# Altium schematic sheet nc_Circuit.SchDoc
size Tabloid; Date: Date; Author: Author 1; Revision: 1; SheetNumber: 4; SheetTotal: 5; Size: 11x17; Sheet_Name: Circuit
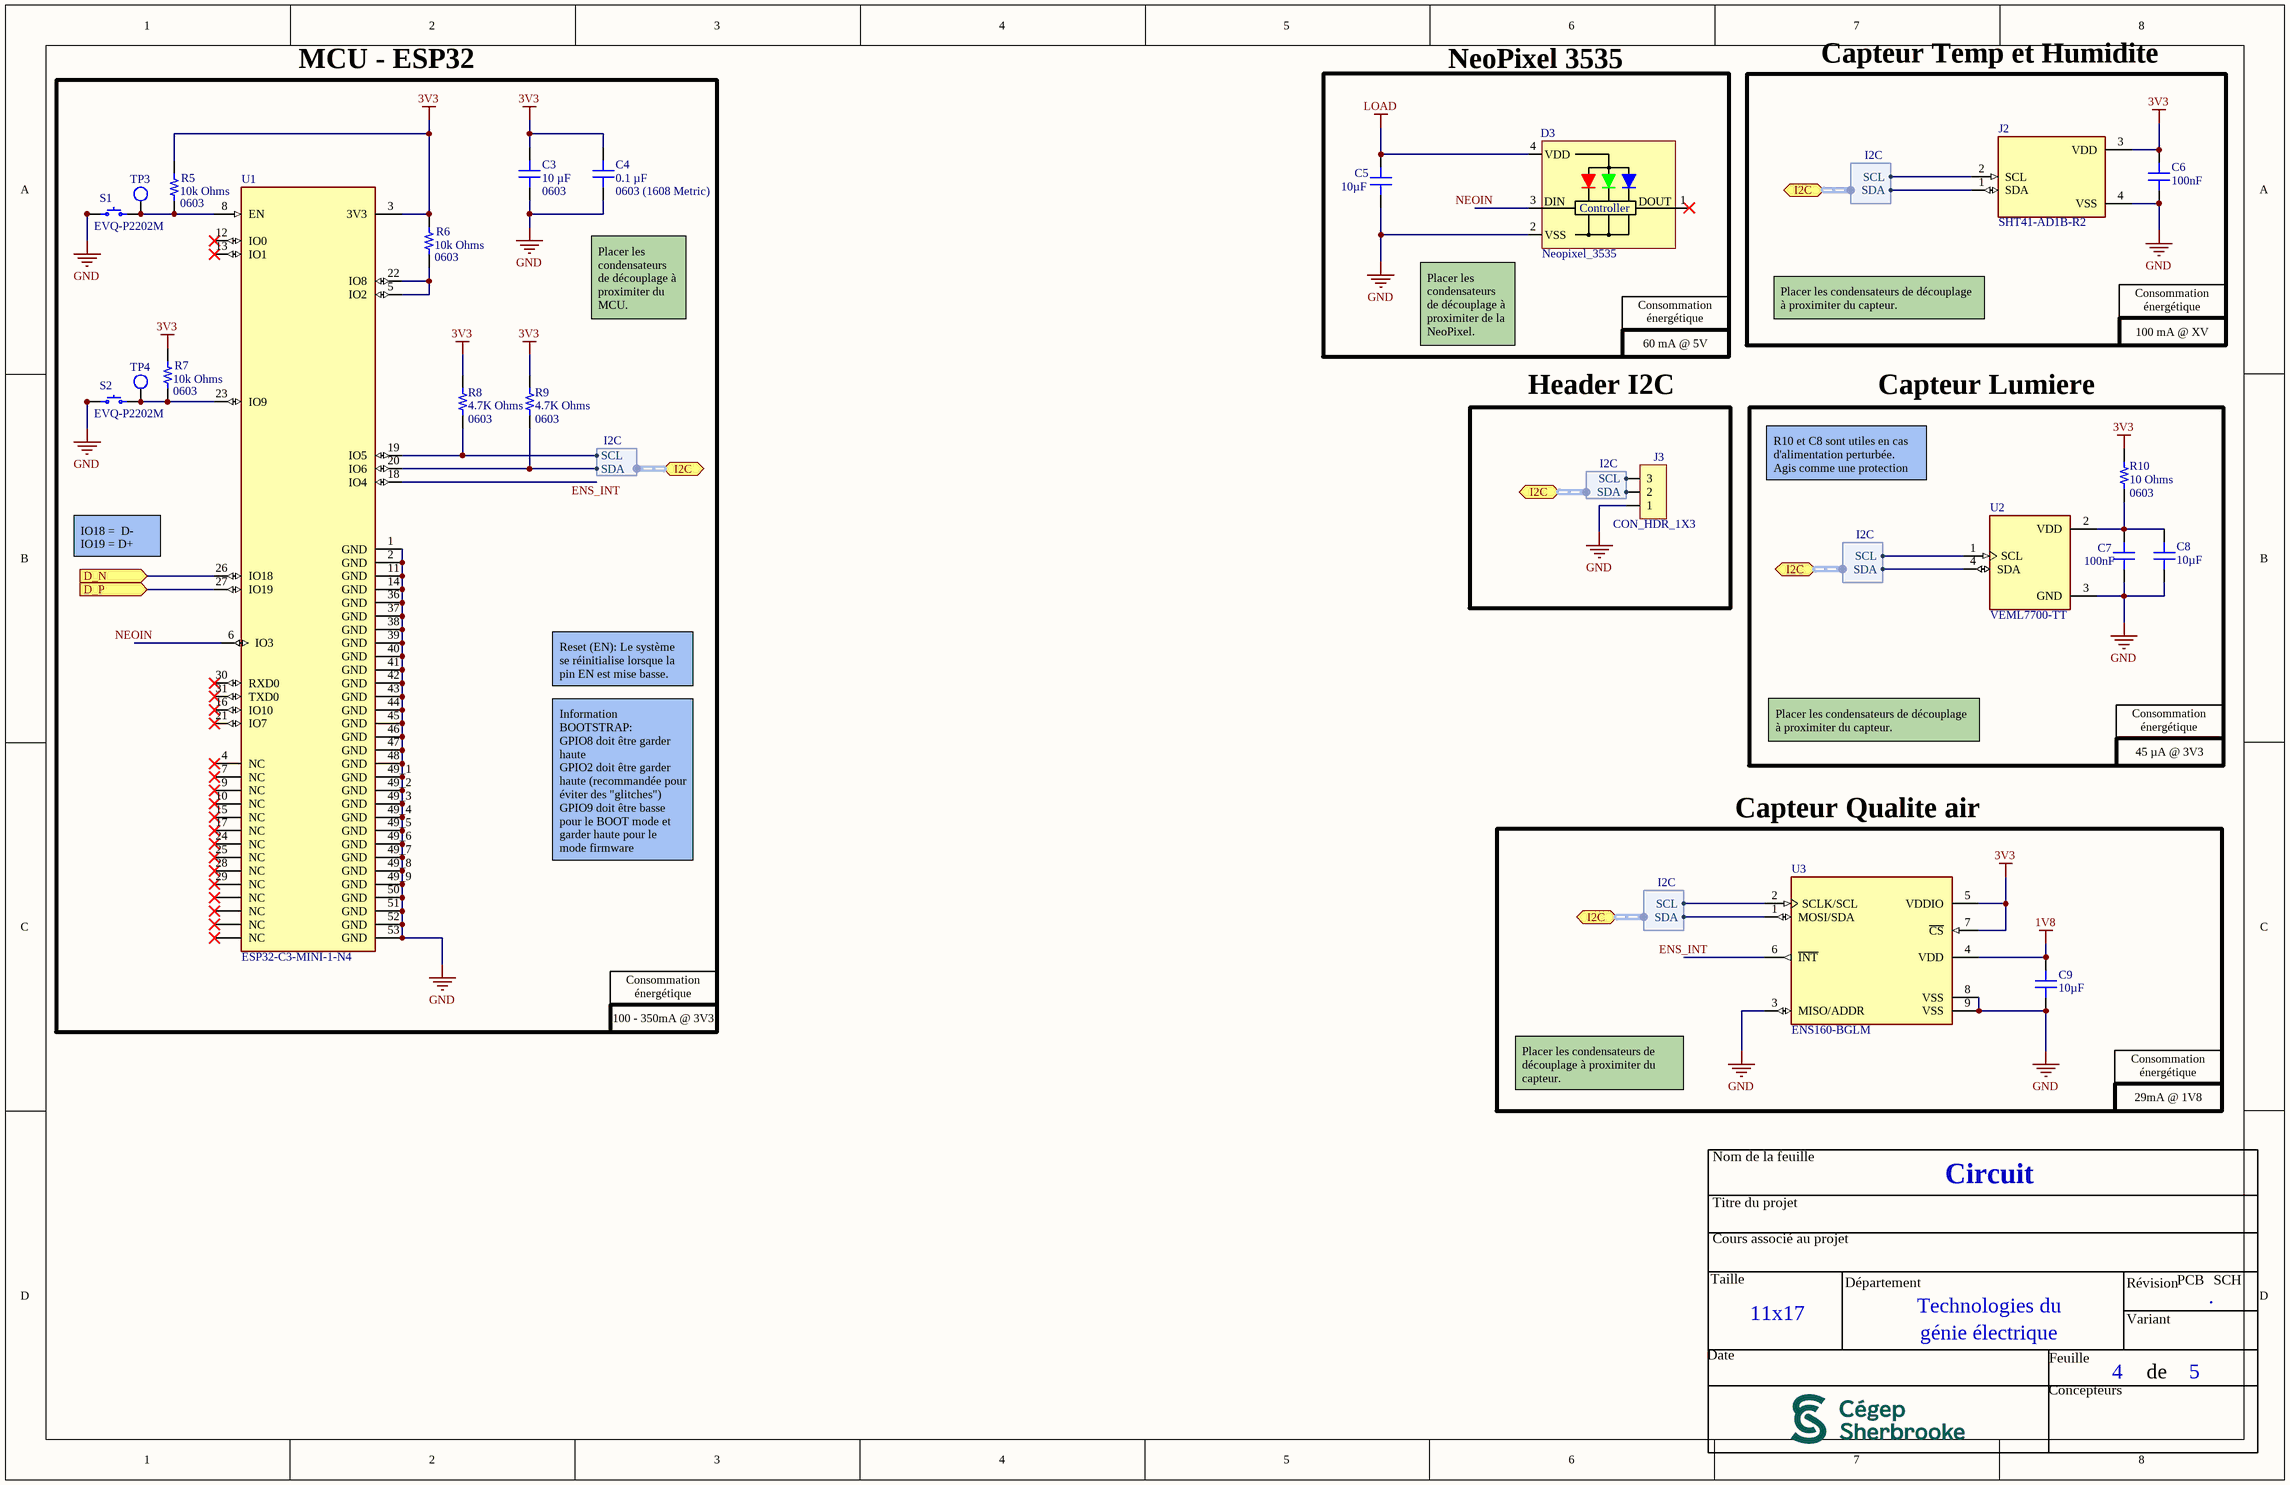
[diagram p0: nc_Circuit.SchDoc]

## Parts
C3  Device Package: 0603  [CAP 0603_1608]  (hidden comment: 10 µF)
C4  Device Package: 0603 (1608 Metric)  [CAP 0603_1608]  (hidden comment: 0.1 µF)
C5  Capacitance: 10µF  [CAP 0603_1608]  (hidden comment: 1µF)
C6  Capacitance: 100nF  [CAP 0603_1608]  (hidden comment: 1µF)
C7  Capacitance: 100nF  [CAP 0603_1608]  (hidden comment: 1µF)
C8  Capacitance: 10µF  [CAP 0603_1608]  (hidden comment: 1µF)
C9  Capacitance: 10µF  [CAP 0603_1608]  (hidden comment: 1µF)
D3  Neopixel_3535  [Neopixel_3535-Footprint-1]
J2  SHT41-AD1B-R2  [SHT4X]
J3  CON_HDR_1X3  [CON_HDR_1x3]
R5  Supplier Device Package: 0603  [RES 0603_1608]  (hidden comment: 10k Ohms)
R6  Supplier Device Package: 0603  [RES 0603_1608]  (hidden comment: 10k Ohms)
R7  Supplier Device Package: 0603  [RES 0603_1608]  (hidden comment: 10k Ohms)
R8  Supplier Device Package: 0603  [RES 0603_1608]  (hidden comment: 4.7K Ohms)
R9  Supplier Device Package: 0603  [RES 0603_1608]  (hidden comment: 4.7K Ohms)
R10  Supplier Device Package: 0603  [RES 0603_1608]  (hidden comment: 10 Ohms)
S1  EVQ-P2202M  [PANASONIC EVQP2]
S2  EVQ-P2202M  [PANASONIC EVQP2]
TP3  TPO_SMD_ROUND_2MM  [TPO_SMD_ROUND_2MM]  (value not drawn)  (no BOM)
TP4  TPO_SMD_ROUND_2MM  [TPO_SMD_ROUND_2MM]  (value not drawn)  (no BOM)
U1  ESP32-C3-MINI-1-N4  [XCVR_ESP32-C3-MINI-1-N4]
U2  VEML7700-TT  [XDCR_VEML7700-TT]
U3  ENS160-BGLM  [XDCR_ENS160-BGLM]

## Blocks framed on the sheet
MCU - ESP32: C3 C4 R5-R9 S1 S2 TP3 TP4 U1
NeoPixel 3535: C5 D3
Capteur Temp et Humidite: C6 J2
Header I2C: J3
Capteur Lumiere: C7 C8 R10 U2
Capteur Qualite air: C9 U3

## Ports
D_N (in), D_P (in), I2C (bidir, harness I2C)

## Harnesses
I2C: SCL, SDA

## Nets
1V8: C9.2 U3.4(VDD)
3V3: C3.2 C4.2 C6.2 J2.3(VDD) R5.1 R6.1 R7.1 R8.2 R9.2 R10.2 U1.3(3V3) U3.5(VDDIO) U3.7(~{CS})
GND: C3.1 C4.1 C5.1 C6.1 C7.1 C8.1 C9.1 D3.2(VSS) J2.4(VSS) J3.1 S1.1 S1.2 S2.1 S2.2 U1.1(GND) U1.2(GND) U1.11(GND) U1.14(GND) U1.36(GND) U1.37(GND) U1.38(GND) U1.39(GND) U1.40(GND) U1.41(GND) U1.42(GND) U1.43(GND) U1.44(GND) U1.45(GND) U1.46(GND) U1.47(GND) U1.48(GND) U1.49_1(GND) U1.49_2(GND) U1.49_3(GND) U1.49_4(GND) U1.49_5(GND) U1.49_6(GND) U1.49_7(GND) U1.49_8(GND) U1.49_9(GND) U1.50(GND) U1.51(GND) U1.52(GND) U1.53(GND) U2.3(GND) U3.3(MISO/ADDR) U3.8(VSS) U3.9(VSS)
LOAD: C5.2 D3.4(VDD)
D_N: U1.26(IO18) ; port D_N
D_P: U1.27(IO19) ; port D_P
ENS_INT: U1.18(IO4) U3.6(~{INT})
NEOIN: D3.3(DIN) U1.6(IO3)
NetC7_2: C7.2 C8.2 R10.1 U2.2(VDD)
NetJ2_1: J2.1(SDA) J3.2 R9.1 U1.20(IO6) U2.4(SDA) U3.1(MOSI/SDA) ; port I2C.SDA
NetJ2_2: J2.2(SCL) J3.3 R8.1 U1.19(IO5) U2.1(SCL) U3.2(SCLK/SCL) ; port I2C.SCL
NetR5_2: R5.2 S1.3 S1.4 TP3.1 U1.8(EN)
NetR6_2: R6.2 U1.5(IO2) U1.22(IO8)
NetR7_2: R7.2 S2.3 S2.4 TP4.1 U1.23(IO9)

Not connected (* = marked no-connect by the designer): D3 1(DOUT)*; U1 4(NC)* 7(NC)* 9(NC)* 10(NC)* 12(IO0)* 13(IO1)* 15(NC)* 16(IO10)* 17(NC)* 21(IO7)* 24(NC)* 25(NC)* 28(NC)* 29(NC)* 30(RXD0)* 31(TXD0)* 32(NC)* 33(NC)* 34(NC)* 35(NC)*

## Notes on the sheet
- (near C4) Placer les condensateurs de découplage à proximiter du MCU.
- (near D3) Placer les condensateurs de découplage à proximiter de la NeoPixel.
- Consommation énergétique
- 60 mA @ 5V
- Placer les condensateurs de découplage à proximiter du capteur.
- 100 mA @ XV
- R10 et C8 sont utiles en cas d'alimentation perturbée. Agis comme une protection supplémentaire
- IO18 =  D-
  IO19 = D+
- Reset (EN): Le système se réinitialise lorsque la pin EN est mise basse.
- 45 µA @ 3V3
- Information BOOTSTRAP:
  GPIO8 doit être garder haute
  GPIO2 doit être garder haute (recommandée pour éviter des "glitches")
  GPIO9 doit être basse pour le BOOT mode et garder haute pour le mode firmware
- 100 - 350mA @ 3V3
- 29mA @ 1V8
- Nom de la feuille
- Titre du projet
- Cours associé au projet
- Taille
- Département
- Technologies du
- Révision
- PCB
- .
- SCH
- Date
- génie électrique
- Feuille
- Variant
- de
- Concepteurs
- (in symbol CMP-851-000001-3) Controller

## Library data of the parts
C3 = GRM188R60J106ME47D: CAP CER 10UF 6.3V X5R 0603; manufacturer: Murata Electronics; Tolerance: ±20%; Part Number: GRM188R60J106ME47D; Capacitance: 10 µF; Applications: General Purpose; componentlink1description: Datasheet; componentlink1url: https://www.murata.com/~/media/webrenewal/support/library/catalog/products/capacitor/mlcc/c02e.ashx?la=en-us; componentlink2description: DigiKey Link; componentlink2url: https://www.digikey.com/en/products/detail/murata-electronics/GRM188R60J106ME47D/965910; lastupdated: 06/04/2026 19:23:52; Lifecycle Status: Active; Minimum Order: 1; Mounting Type: Surface Mount, MLCC; Operating Temperature: -55°C ~ 85°C; Package / Case: 0603 (1608 Metric); packaging: TapeAndReel; partid: 2351; Part Status: Active; price: 0.01; series: GRM; Size / Dimension: 0.063" L x 0.031" W (1.60mm x 0.80mm); Supplier 1: DigiKey; Supplier Part Number 1: 490-3896-1-ND; Temperature Coefficient: X5R; Thickness (Max): 0.035" (0.90mm); value: 10 µF; Voltage - Rated: 6.3V
C4 = 6R3X14W104MV4T: CAP CER 0.1UF 6.3V X7R 0603; manufacturer: Johanson Dielectrics Inc.; Tolerance: ±20%; Part Number: 6R3X14W104MV4T; Capacitance: 0.1 µF; Applications: Bypass, Decoupling; componentlink1description: Datasheet; componentlink1url: https://www.johansondielectrics.com/downloads/x2y-filter-and-decoupling-capacitors.pdf; componentlink2description: DigiKey Link; componentlink2url: https://www.digikey.com/en/products/detail/johanson-dielectrics-inc/6R3X14W104MV4T/1556331; lastupdated: 06/04/2026 19:23:51; Lifecycle Status: Active; Minimum Order: 1; Mounting Type: Surface Mount, MLCC; Operating Temperature: -55°C ~ 125°C; Package / Case: 0603 (1608 Metric); packaging: TapeAndReel; partid: 2650; Part Status: Active; price: 0.08; series: X2Y®; Size / Dimension: 0.064" L x 0.035" W (1.63mm x 0.89mm); Supplier 1: DigiKey; Supplier Part Number 1: 709-1009-1-ND; Temperature Coefficient: X7R; Thickness (Max): 0.026" (0.66mm); value: 0.1 µF; Voltage - Rated: 6.3V; Features: Low ESL (X2Y)
C5-C9 = 06035C105KAT2A: CAP CER 1UF 50V X7R 0603; manufacturer: AVX Corporation; Tolerance: ±10%; Part Number: 06035C105KAT2A; Applications: General Purpose; componentlink1description: Datasheet; componentlink1url: http://datasheets.avx.com/X7RDielectric.pdf; componentlink2description: DigiKey Link; componentlink2url: http://digikey.com/product-detail/en/avx-corporation/06035C105KAT2A/478-10073-1-ND/6564295; Device Package: 0603 (1608 Metric); lastupdated: 2020-09-02 1:03:35 AM; Lifecycle Status: Active; Minimum Order: 1; Mounting Type: Surface Mount, MLCC; Operating Temperature: -55°C ~ 125°C; Package / Case: 0603 (1608 Metric); packaging: TapeAndReel; partid: 2905; Part Status: Active; price: 0.15; series: -; Size / Dimension: 0.063" L x 0.032" W (1.60mm x 0.81mm); Supplier 1: DigiKey; Supplier Part Number 1: 478-10073-1-ND; Temperature Coefficient: X7R; Thickness (Max): 0.020" (0.50mm); value: 1µF; Voltage - Rated: 50V
D3 = CMP-851-000001-3: Neopixel Mini 3535 Rgb Leds W/ Integrated Driver Chip - White - Pack Of 10
J2 = SHT41-AD1B-R2: Digital Relative Humidity Temperature Sensor, Â±1.8 / max 2.5 %RH, Â±0.2 Â°C, Ultra-Low-Power, with filtermembrane; MF: Sensirion; SnapEDA_Link: https://www.snapeda.com/parts/SHT41-AD1B-R2/Sensirion/view-part/?ref=snap; Purchase-URL: https://pricing.snapeda.com/search/part/SHT41-AD1B-R2/?ref=eda; Package: Package; MP: SHT41-AD1B-R2; Price: None; Availability: In Stock; Check_prices: https://www.snapeda.com/parts/SHT41-AD1B-R2/Sensirion/view-part/?ref=eda; Value: *
J3 = CMP-005-000001-1: CON - Header 1x3 pins-100Mils - TH; Polarized: No; Source: CEGEP_SHERBROOKE_TGE_LIBRARY.SchLib; Component Type: Standard; Package: TH; Power Max: *; Pin Count: 3; Design Item ID: CON_HDR_1X3; Note: *; Manufacturer #1: *; HelpURL: *; Assembly Type: TH
R5-R7 = ERJ-UP3J151V: RES 150 OHM 5% 1/4W 0603; Manufacturer: Panasonic Electronic Components; Power (Watts): 0.25W, 1/4W; Resistance: 150 Ohms; Temperature Coefficient: ±200ppm/°C; Part Number: ERJ-UP3J151V; Value: 10k Ohms; ComponentLink1Description: Datasheet; ComponentLink1URL: https://b2b-api.panasonic.eu/file_stream/pids/fileversion/4484; ComponentLink2Description: DigiKey Link; ComponentLink2URL: https://www.digikey.com/en/products/detail/panasonic-electronic-components/ERJ-UP3J151V/12092481; Composition: Thick Film; Device Package: 0603 (1608 Metric); Features: Anti-Sulfur, Automotive AEC-Q200, Pulse Withstanding; Height - Seated (Max): 0.022" (0.55mm); LastUpdated: 2024-02-09 8:41:36 PM; Lifecycle Status: Active; Minimum Order: 1; Number of Terminations: 2; Operating Temperature: -55°C ~ 155°C; Package / Case: 0603 (1608 Metric); Packaging: TapeAndReel; PartId: 63618; Part Status: Active; Price: 0.02; Ratings: AEC-Q200; Series: ERJ-UP3; Size / Dimension: 0.063" L x 0.031" W (1.60mm x 0.80mm); Supplier 1: DigiKey; Supplier Part Number 1: 10-ERJ-UP3J151VCT-ND; Tolerance: ±5%
R8-R10 = ERJ-UP3J151V: RES 150 OHM 5% 1/4W 0603; Manufacturer: Panasonic Electronic Components; Power (Watts): 0.25W, 1/4W; Resistance: 5.1k Ohms; Temperature Coefficient: ±200ppm/°C; Part Number: ERJ-UP3J151V; ComponentLink1Description: Datasheet; ComponentLink1URL: https://b2b-api.panasonic.eu/file_stream/pids/fileversion/4484; ComponentLink2Description: DigiKey Link; ComponentLink2URL: https://www.digikey.com/en/products/detail/panasonic-electronic-components/ERJ-UP3J151V/12092481; Composition: Thick Film; Device Package: 0603 (1608 Metric); Features: Anti-Sulfur, Automotive AEC-Q200, Pulse Withstanding; Height - Seated (Max): 0.022" (0.55mm); LastUpdated: 2024-02-09 8:41:36 PM; Lifecycle Status: Active; Minimum Order: 1; Number of Terminations: 2; Operating Temperature: -55°C ~ 155°C; Package / Case: 0603 (1608 Metric); Packaging: TapeAndReel; PartId: 63618; Part Status: Active; Price: 0.02; Ratings: AEC-Q200; Series: ERJ-UP3; Size / Dimension: 0.063" L x 0.031" W (1.60mm x 0.80mm); Supplier 1: DigiKey; Supplier Part Number 1: 10-ERJ-UP3J151VCT-ND; Tolerance: ±5%
  R8 R9: Value: 4.7K Ohms
  R10: Value: 10 Ohms
S1 S2 = EVQ-P2202M: SWITCH TACTILE SPST-NO 0.02A 15V; Part Number: EVQ-P2202M
TP3 TP4 = CMP-007-000003-1: TPO - TEST POINT ROUND SMD PAD ONLY  - 2 MM; Component Type: Standard (No BOM); Polarized: *; Manufacturer #1: *; Part Number #1: *; HelpURL: *; Assembly Type: NONE; Source: CEGEP_SHERBROOKE_TGE_LIBRARY.SchLib; Design Item ID: TPO_SMD_ROUND_2MM; Pin Count: 1; Note: *; Value: *; Package: 2 MM ROUND; Power Max: *
U1 = ESP32-C3-MINI-1-N4: MF: {'manufacturer': u'Espressif Systems'}; Package: None; Price: None; Value: *; MP: ESP32-C3-MINI-1-N4; Availability: Unavailable
U2 = VEML7700-TT: Optical Sensor Ambient - IÂ²C 4-SMD, J-Lead; MF: Vishay Semiconductor; SnapEDA_Link: https://www.snapeda.com/parts/VEML7700-TT/Vishay/view-part/?ref=snap; Package: SMD-4 Vishay Semiconductor; Value: *; MP: VEML7700-TT; Check_prices: https://www.snapeda.com/parts/VEML7700-TT/Vishay/view-part/?ref=eda
U3 = ENS160-BGLM: Air Quality, Carbon Dioxide (CO2), Metal Oxide (MOX) Sensor IÂ²C, SPI; MF: ScioSense; SnapEDA_Link: https://www.snapeda.com/parts/ENS160-BGLM/ScioSense/view-part/?ref=snap; Package: LGA-9 ScioSense; Value: *; MP: ENS160-BGLM; Check_prices: https://www.snapeda.com/parts/ENS160-BGLM/ScioSense/view-part/?ref=eda